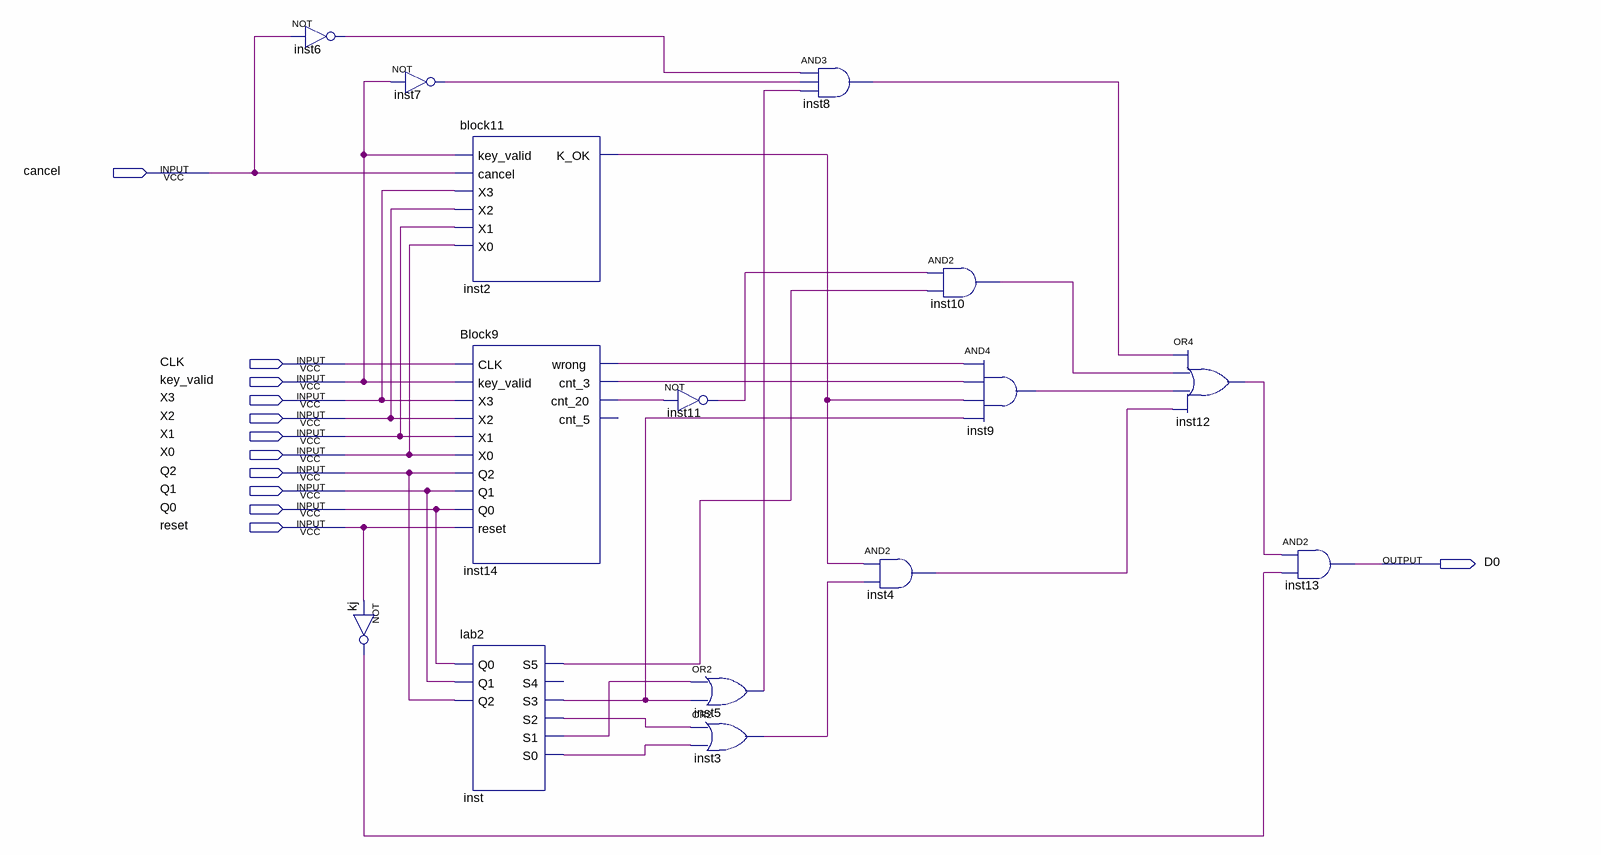
[diagram p0: schematic sheet]
// Quartus schematic block14.bdf as structural Verilog: 15 symbols, 12 pins
module block14 (
  input  cancel,
  input  CLK,
  input  key_valid,
  input  X3,
  input  X2,
  input  X1,
  input  X0,
  input  Q2,
  input  Q1,
  input  Q0,
  input  reset,
  output D0
);

  wire inst2_k_ok, inst3_out, inst4_out, inst5_out, inst6_out, inst7_out, inst8_out, inst9_out, inst10_out,
       inst11_out, inst12_out, inst14_cnt_3, inst14_cnt_20, inst14_wrong, inst_s0, inst_s1, inst_s2, inst_s3,
       inst_s5, kj_out;

  not inst6 (inst6_out, cancel);
  not kj (kj_out, reset);
  not inst7 (inst7_out, key_valid);
  block11 inst2 (.key_valid(key_valid), .cancel(cancel), .X3(X3), .X2(X2), .X1(X1), .X0(X0), .K_OK(inst2_k_ok));
  Block9 inst14 (
    .CLK(CLK), .key_valid(key_valid), .X3(X3), .X2(X2), .X1(X1), .X0(X0), .Q2(Q2), .Q1(Q1), .Q0(Q0),
    .reset(reset), .wrong(inst14_wrong), .cnt_3(inst14_cnt_3), .cnt_20(inst14_cnt_20));  // open: cnt_5
  lab2 inst (
    .Q0(Q0), .Q1(Q1), .Q2(Q2), .S5(inst_s5), .S3(inst_s3), .S2(inst_s2), .S1(inst_s1), .S0(inst_s0));  // open: S4
  not inst11 (inst11_out, inst14_cnt_20);
  or inst5 (inst5_out, inst_s1, inst_s3);
  or inst3 (inst3_out, inst_s2, inst_s0);
  and inst8 (inst8_out, inst6_out, inst7_out, inst5_out);
  and inst4 (inst4_out, inst2_k_ok, inst3_out);
  and inst10 (inst10_out, inst11_out, inst_s5);
  and inst9 (inst9_out, inst14_wrong, inst14_cnt_3, inst2_k_ok, inst_s3);
  or inst12 (inst12_out, inst8_out, inst10_out, inst9_out, inst4_out);
  and inst13 (D0, inst12_out, kj_out);
endmodule
